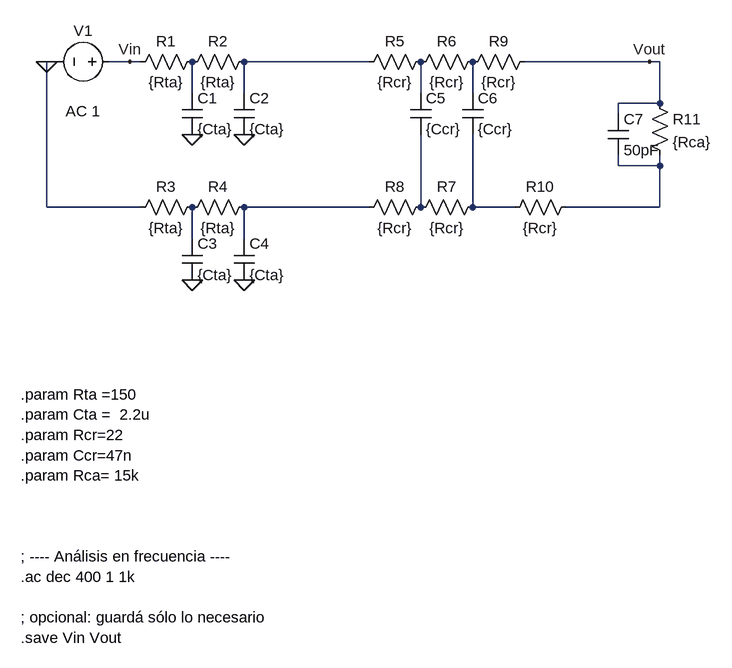
[diagram p0: schematic fitlro_completo_fran.asc]
fitlro_completo_fran.asc, the LTspice schematic file:
Version 4.1
SHEET 1 1404 1056
WIRE -96 80 -112 80
WIRE 16 80 -16 80
WIRE 32 80 16 80
WIRE 384 80 192 80
WIRE 816 80 624 80
WIRE 832 80 816 80
WIRE 112 128 112 80
WIRE 192 128 192 80
WIRE 464 128 464 80
WIRE 544 128 544 80
WIRE 832 144 832 80
WIRE 832 144 768 144
WIRE 768 160 768 144
WIRE 768 240 768 224
WIRE 832 240 832 224
WIRE 832 240 768 240
WIRE -112 304 -112 80
WIRE 32 304 -112 304
WIRE 384 304 192 304
WIRE 464 304 464 192
WIRE 544 304 544 192
WIRE 608 304 544 304
WIRE 832 304 832 240
WIRE 832 304 688 304
WIRE 112 352 112 304
WIRE 192 352 192 304
FLAG 112 192 0
FLAG 192 192 0
FLAG 16 80 Vin
FLAG 112 416 0
FLAG 192 416 0
FLAG 816 80 Vout
FLAG -112 80 0
SYMBOL res 128 64 R90
WINDOW 0 0 56 VBottom 2
WINDOW 3 32 56 VTop 2
SYMATTR InstName R1
SYMATTR Value {Rta}
SYMBOL res 208 64 R90
WINDOW 0 0 56 VBottom 2
WINDOW 3 32 56 VTop 2
SYMATTR InstName R2
SYMATTR Value {Rta}
SYMBOL cap 96 128 R0
SYMATTR InstName C1
SYMATTR Value {Cta}
SYMBOL cap 176 128 R0
SYMATTR InstName C2
SYMATTR Value {Cta}
SYMBOL voltage 0 80 R90
WINDOW 0 -32 56 VBottom 2
WINDOW 3 32 56 VTop 2
WINDOW 123 60 56 VTop 2
WINDOW 39 0 0 Left 0
SYMATTR InstName V1
SYMATTR Value ""
SYMATTR Value2 AC 1
SYMBOL res 128 288 R90
WINDOW 0 0 56 VBottom 2
WINDOW 3 32 56 VTop 2
SYMATTR InstName R3
SYMATTR Value {Rta}
SYMBOL res 208 288 R90
WINDOW 0 0 56 VBottom 2
WINDOW 3 32 56 VTop 2
SYMATTR InstName R4
SYMATTR Value {Rta}
SYMBOL cap 96 352 R0
SYMATTR InstName C3
SYMATTR Value {Cta}
SYMBOL cap 176 352 R0
SYMATTR InstName C4
SYMATTR Value {Cta}
SYMBOL res 480 64 R90
WINDOW 0 0 56 VBottom 2
WINDOW 3 32 56 VTop 2
SYMATTR InstName R5
SYMATTR Value {Rcr}
SYMBOL res 560 64 R90
WINDOW 0 0 56 VBottom 2
WINDOW 3 32 56 VTop 2
SYMATTR InstName R6
SYMATTR Value {Rcr}
SYMBOL cap 448 128 R0
SYMATTR InstName C5
SYMATTR Value {Ccr}
SYMBOL cap 528 128 R0
SYMATTR InstName C6
SYMATTR Value {Ccr}
SYMBOL res 560 288 R90
WINDOW 0 0 56 VBottom 2
WINDOW 3 32 56 VTop 2
SYMATTR InstName R7
SYMATTR Value {Rcr}
SYMBOL res 480 288 R90
WINDOW 0 0 56 VBottom 2
WINDOW 3 32 56 VTop 2
SYMATTR InstName R8
SYMATTR Value {Rcr}
SYMBOL res 704 288 R90
WINDOW 0 0 56 VBottom 2
WINDOW 3 32 56 VTop 2
SYMATTR InstName R10
SYMATTR Value {Rcr}
SYMBOL res 640 64 R90
WINDOW 0 0 56 VBottom 2
WINDOW 3 32 56 VTop 2
SYMATTR InstName R9
SYMATTR Value {Rcr}
SYMBOL res 816 128 R0
SYMATTR InstName R11
SYMATTR Value {Rca}
SYMBOL cap 752 160 R0
SYMATTR InstName C7
SYMATTR Value 50pF
TEXT -152 592 Left 2 !.param Rta =150\n.param Cta =  2.2u\n.param Rcr=22\n.param Ccr=47n\n.param Rca= 15k\n \n \n \n; ---- Análisis en frecuencia ----\n.ac dec 400 1 1k\n \n; opcional: guardá sólo lo necesario\n.save Vin Vout

The netlist it stands for:
* fitlro_completo_fran.asc
R1 N002 Vin {Rta}
R2 N001 N002 {Rta}
C1 N002 0 {Cta}
C2 N001 0 {Cta}
V1 Vin 0 AC 1
R3 N009 0 {Rta}
R4 N006 N009 {Rta}
C3 N009 0 {Cta}
C4 N006 0 {Cta}
R5 N003 N001 {Rcr}
R6 N004 N003 {Rcr}
C5 N003 N007 {Ccr}
C6 N004 N008 {Ccr}
R7 N008 N007 {Rcr}
R8 N007 N006 {Rcr}
R10 N005 N008 {Rcr}
R9 Vout N004 {Rcr}
R11 Vout N005 {Rca}
C7 Vout N005 50pF
.param Rta =150
.param Cta =  2.2u
.param Rcr=22
.param Ccr=47n
.param Rca= 15k
; ---- Análisis en frecuencia ----
.ac dec 400 1 1k
; opcional: guardá sólo lo necesario
.save Vin Vout
.backanno
.end